# Altium project Vehicle_Interface_Tester.PrjPcb
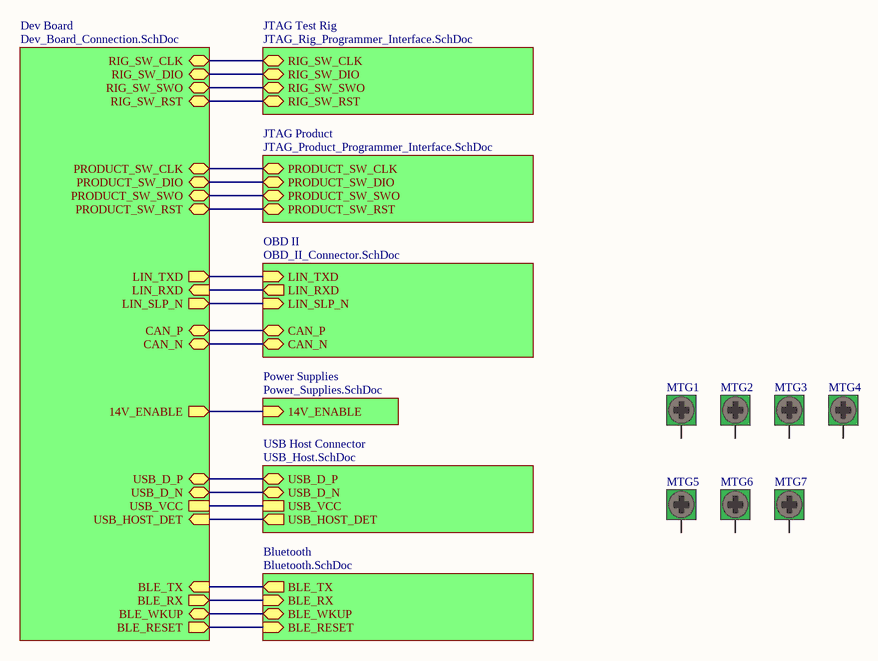
[diagram p0: Top_Level.SchDoc]
13 sheets, 100 parts. Net scope: hierarchical (ports join the sheet entries above them; power ports are global).
Board file: Vehicle_Interface_Tester.PcbDoc
Sheets:
  Top_Level.SchDoc
    Dev Board = Dev_Board_Connection.SchDoc
    Power Supplies = Power_Supplies.SchDoc
      Input Power = Input_Power.SchDoc
      14V Buck Supply = 14V_Buck.SchDoc
      Vehicle Power = Vehicle_Power.SchDoc
      3V3 Buck Supply = 3V3_Buck.SchDoc
    USB Host Connector = USB_Host.SchDoc
    Bluetooth = Bluetooth.SchDoc
    OBD II = OBD_II_Connector.SchDoc
      K-Line = K-Line.SchDoc
    JTAG Product = JTAG_Product_Programmer_Interface.SchDoc
    JTAG Test Rig = JTAG_Rig_Programmer_Interface.SchDoc

## Sheet Top_Level.SchDoc
size A; Author: Jared Ainsworth; CompanyName: UpRev LLC; Engineer: Jared Ainsworth; Organization: UpRev LLC; Address1: 4807 Commercial Park Dr.; Address2: Austin, TX 78724; Address3: United States; Address4: www.UpRev.com; SheetNumber: 1; SheetTotal: 13

### Parts
MTG1  Mounting Hole M3  [Mounting Hole M3]  (value not drawn)  (no BOM)
MTG2  Mounting Hole M3  [Mounting Hole M3]  (value not drawn)  (no BOM)
MTG3  Mounting Hole M3  [Mounting Hole M3]  (value not drawn)  (no BOM)
MTG4  Mounting Hole M3  [Mounting Hole M3]  (value not drawn)  (no BOM)
MTG5  Mounting Hole M3  [Mounting Hole M3]  (value not drawn)  (no BOM)
MTG6  Mounting Hole M3  [Mounting Hole M3]  (value not drawn)  (no BOM)
MTG7  Mounting Hole M3  [Mounting Hole M3]  (value not drawn)  (no BOM)

### Sub-sheets
Bluetooth = Bluetooth.SchDoc: BLE_TX (out), BLE_RX (in), BLE_WKUP (bidir), BLE_RESET (in)
Dev Board = Dev_Board_Connection.SchDoc: RIG_SW_CLK (bidir), RIG_SW_DIO (bidir), RIG_SW_SWO (bidir), RIG_SW_RST (bidir), PRODUCT_SW_CLK (bidir), PRODUCT_SW_DIO (bidir), PRODUCT_SW_SWO (bidir), PRODUCT_SW_RST (bidir), LIN_TXD (out), LIN_RXD (in), LIN_SLP_N (out), CAN_P (bidir), CAN_N (bidir), BLE_RESET (out), BLE_WKUP (bidir), BLE_RX (out), BLE_TX (in), USB_HOST_DET (in), USB_VCC, USB_D_N (bidir), USB_D_P (bidir), 14V_ENABLE (out)
JTAG Product = JTAG_Product_Programmer_Interface.SchDoc: PRODUCT_SW_CLK (bidir), PRODUCT_SW_DIO (bidir), PRODUCT_SW_RST (bidir), PRODUCT_SW_SWO (bidir)
JTAG Test Rig = JTAG_Rig_Programmer_Interface.SchDoc: RIG_SW_CLK (bidir), RIG_SW_DIO (bidir), RIG_SW_SWO (bidir), RIG_SW_RST (bidir)
OBD II = OBD_II_Connector.SchDoc: LIN_TXD (in), LIN_RXD (out), LIN_SLP_N (in), CAN_P (bidir), CAN_N (bidir)
Power Supplies = Power_Supplies.SchDoc: 14V_ENABLE (in)
USB Host Connector = USB_Host.SchDoc: USB_D_P (bidir), USB_D_N (bidir), USB_VCC, USB_HOST_DET (out)

### Nets
VBUS: sheet Dev Board/USB_VCC, sheet USB Host Connector/USB_VCC
BLE_RESET: sheet Dev Board/BLE_RESET, sheet Bluetooth/BLE_RESET
BLE_RX: sheet Dev Board/BLE_RX, sheet Bluetooth/BLE_RX
BLE_TX: sheet Dev Board/BLE_TX, sheet Bluetooth/BLE_TX
BLE_WKUP: sheet Dev Board/BLE_WKUP, sheet Bluetooth/BLE_WKUP
CAN_N: sheet Dev Board/CAN_N, sheet OBD II/CAN_N
CAN_P: sheet Dev Board/CAN_P, sheet OBD II/CAN_P
LIN_RXD: sheet Dev Board/LIN_RXD, sheet OBD II/LIN_RXD
LIN_SLP_N: sheet Dev Board/LIN_SLP_N, sheet OBD II/LIN_SLP_N
LIN_TXD: sheet Dev Board/LIN_TXD, sheet OBD II/LIN_TXD
USB_D_N: sheet Dev Board/USB_D_N, sheet USB Host Connector/USB_D_N
USB_D_P: sheet Dev Board/USB_D_P, sheet USB Host Connector/USB_D_P
NetJ1_10: sheet Dev Board/PRODUCT_SW_CLK, sheet JTAG Product/PRODUCT_SW_CLK
NetJ1_11: sheet Dev Board/14V_ENABLE, sheet Power Supplies/14V_ENABLE
NetJ1_13: sheet Dev Board/PRODUCT_SW_DIO, sheet JTAG Product/PRODUCT_SW_DIO
NetJ1_15: sheet Dev Board/PRODUCT_SW_RST, sheet JTAG Product/PRODUCT_SW_RST
NetJ1_16: sheet Dev Board/PRODUCT_SW_SWO, sheet JTAG Product/PRODUCT_SW_SWO
NetJ3_4: sheet Dev Board/USB_HOST_DET, sheet USB Host Connector/USB_HOST_DET
NetJ5_2: sheet Dev Board/RIG_SW_CLK, sheet JTAG Test Rig/RIG_SW_CLK
NetJ5_4: sheet Dev Board/RIG_SW_DIO, sheet JTAG Test Rig/RIG_SW_DIO
NetJ5_5: sheet Dev Board/RIG_SW_RST, sheet JTAG Test Rig/RIG_SW_RST
NetJ5_6: sheet Dev Board/RIG_SW_SWO, sheet JTAG Test Rig/RIG_SW_SWO

Not connected (* = marked no-connect by the designer): MTG1 1(M3_Mounting_Hole); MTG2 1(M3_Mounting_Hole); MTG3 1(M3_Mounting_Hole); MTG4 1(M3_Mounting_Hole); MTG5 1(M3_Mounting_Hole); MTG6 1(M3_Mounting_Hole); MTG7 1(M3_Mounting_Hole)

### Notes on the sheet
- Title
- Size:
- Engineer:
- A
- Number:
- Revision:
- Sheet
- of
- File:

### Library data of the parts
MTG1-MTG7 = Mounting Hole M3: M3 Mounting Hole; Manufacturer Part Number: DNP; Manufacturer: DNP

## Sheet Dev_Board_Connection.SchDoc
size A; Author: Jared Ainsworth; CompanyName: UpRev LLC; Engineer: Jared Ainsworth; Organization: UpRev LLC; Address1: 4807 Commercial Park Dr.; Address2: Austin, TX 78724; Address3: United States; Address4: www.UpRev.com; SheetNumber: 2; SheetTotal: 13
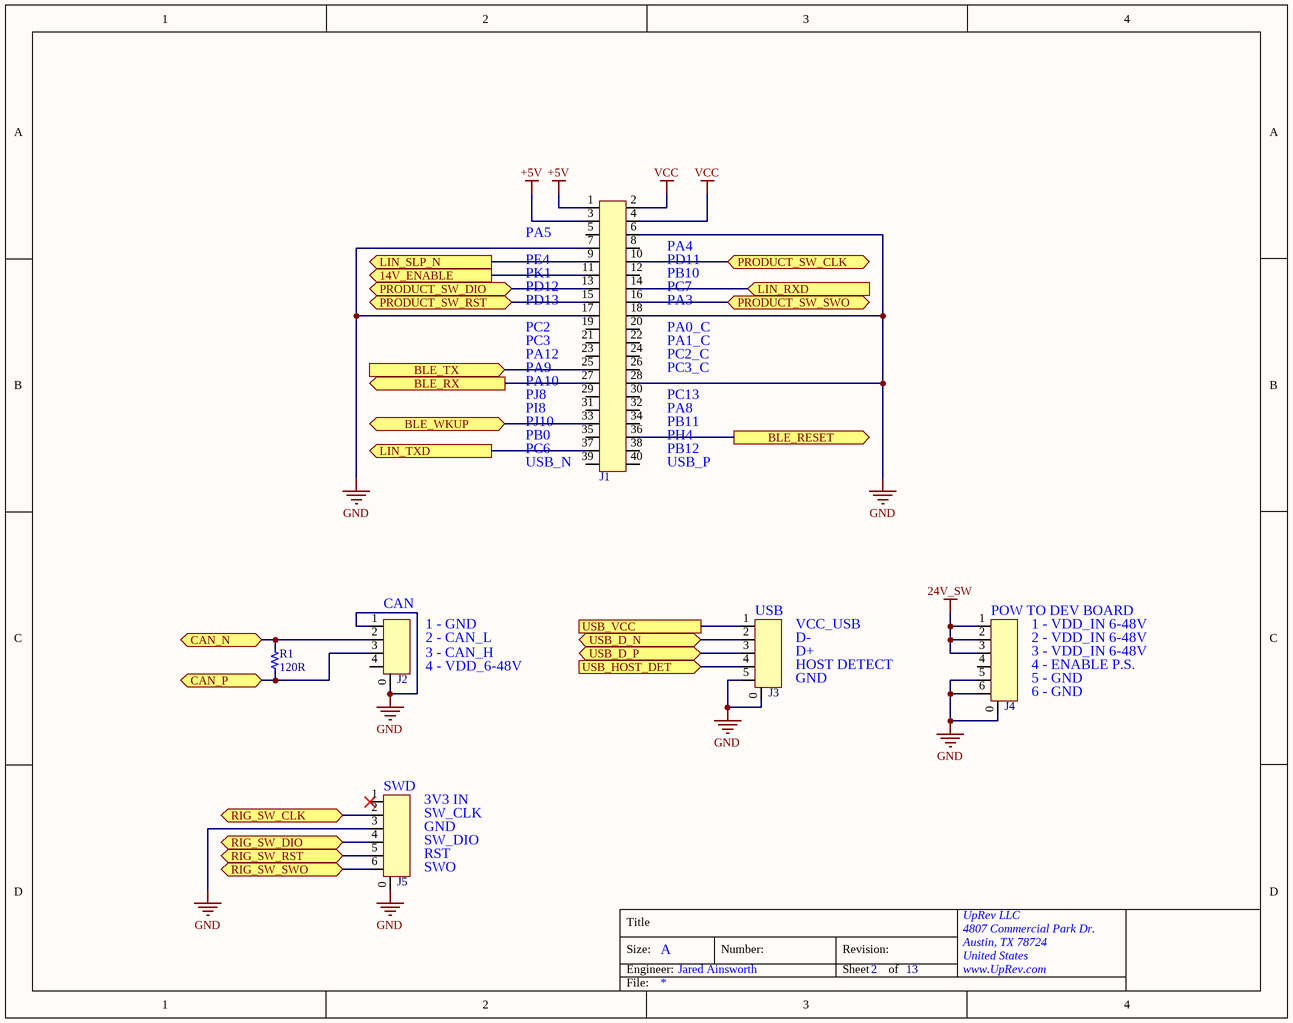
[diagram p1: Dev_Board_Connection.SchDoc]

### Parts
J1  HC-PM127-4.3H-2x20PS  [Connector 40 Pos Header 1.27mm (.5") HC-PM127-4.3H-2x20PS]  (value not drawn)
J2  532610471  [Connector 4 pos PicoBlade Molex 532610001]  (value not drawn)
J3  532610671  [Connector 5 pos PicoBlade Molex 532610571]  (value not drawn)
J4  532610571  [Connector 6 pos PicoBlade Molex 532610001]  (value not drawn)
J5  532610571  [Connector 6 pos PicoBlade Molex 532610001]  (value not drawn)
R1  120R  [R1206 (3216)]

### Ports
14V_ENABLE (out, see Top_Level[2C], Power_Supplies[2C], Vehicle_Power[1C]), BLE_RESET (out, see Top_Level[2D], Bluetooth[3B]), BLE_RX (out, see Top_Level[2D], Bluetooth[1B]), BLE_TX (in, see Top_Level[2D], Bluetooth[1C]), BLE_WKUP (bidir, see Top_Level[2D], Bluetooth[1B]), CAN_N (bidir, see Top_Level[2C], OBD_II_Connector[1B]), CAN_P (bidir, see Top_Level[2C], OBD_II_Connector[1B]), LIN_RXD (in, see Top_Level[2B], K-Line[1B], OBD_II_Connector[1B]), LIN_SLP_N (out, see Top_Level[2B], K-Line[1B], OBD_II_Connector[1B]), LIN_TXD (out, see Top_Level[2B], K-Line[1C], OBD_II_Connector[1B]), PRODUCT_SW_CLK (bidir, see Top_Level[2B], JTAG_Product_Programmer_Interface[3B]), PRODUCT_SW_DIO (bidir, see Top_Level[2B], JTAG_Product_Programmer_Interface[3B]), PRODUCT_SW_RST (bidir, see Top_Level[2B], JTAG_Product_Programmer_Interface[3C]), PRODUCT_SW_SWO (bidir, see Top_Level[2B], JTAG_Product_Programmer_Interface[3C]), RIG_SW_CLK (bidir, see Top_Level[2A], JTAG_Rig_Programmer_Interface[3B]), RIG_SW_DIO (bidir, see Top_Level[2B], JTAG_Rig_Programmer_Interface[3B]), RIG_SW_RST (bidir, see Top_Level[2B], JTAG_Rig_Programmer_Interface[3C]), RIG_SW_SWO (bidir, see Top_Level[2B], JTAG_Rig_Programmer_Interface[3C]), USB_D_N (bidir, see Top_Level[2C], USB_Host[1B]), USB_D_P (bidir, see Top_Level[2C], USB_Host[1B]), USB_HOST_DET (in, see Top_Level[2C], USB_Host[1B]), USB_VCC (see Top_Level[2C], USB_Host[1B])

### Nets
24V_SW: J4.1 J4.2 J4.3
+5V: J1.1 J1.3
GND: J1.6 J1.7 J1.17 J1.18 J1.28 J2.0 J2.1 J3.0 J3.5 J4.0 J4.5 J4.6 J5.0 J5.3
VBUS: J3.1 ; port USB_VCC
VCC: J1.2 J1.4
BLE_RESET: J1.36 ; port BLE_RESET
BLE_RX: J1.27 ; port BLE_RX
BLE_TX: J1.25 ; port BLE_TX
BLE_WKUP: J1.33 ; port BLE_WKUP
CAN_N: J2.2 R1.2 ; port CAN_N
CAN_P: J2.3 R1.1 ; port CAN_P
LIN_RXD: J1.14 ; port LIN_RXD
LIN_SLP_N: J1.9 ; port LIN_SLP_N
LIN_TXD: J1.37 ; port LIN_TXD
USB_D_N: J3.2 ; port USB_D_N
USB_D_P: J3.3 ; port USB_D_P
NetJ1_10: J1.10 ; port PRODUCT_SW_CLK
NetJ1_11: J1.11 ; port 14V_ENABLE
NetJ1_13: J1.13 ; port PRODUCT_SW_DIO
NetJ1_15: J1.15 ; port PRODUCT_SW_RST
NetJ1_16: J1.16 ; port PRODUCT_SW_SWO
NetJ3_4: J3.4 ; port USB_HOST_DET
NetJ5_2: J5.2 ; port RIG_SW_CLK
NetJ5_4: J5.4 ; port RIG_SW_DIO
NetJ5_5: J5.5 ; port RIG_SW_RST
NetJ5_6: J5.6 ; port RIG_SW_SWO

Not connected (* = marked no-connect by the designer): J1 5 8 12 19 20 21 22 23 24 26 29 30 31 32 34 35 38 39 40; J2 4; J4 4; J5 1*

### Notes on the sheet
- (near J1) PA5
- (near J1) PE4
- (near J1) PK1
- (near J1) PD12
- (near J1) PA4
- (near J1) PD11
- (near J1) PB10
- (near J1) PC7
- (near J1) PD13
- (near J1) PC2
- (near J1) PC3
- (near J1) PA12
- (near J1) PA9
- (near J1) PA3
- (near J1) PA0_C
- (near J1) PA1_C
- (near J1) PC2_C
- (near J1) PC3_C
- (near J1) PA10
- (near J1) PJ8
- (near J1) PI8
- (near J1) PJ10
- (near J1) PC13
- (near J1) PA8
- (near J1) PB11
- (near J1) PB0
- (near J1) PC6
- (near J1) USB_N
- (near J1) PH4
- (near J1) PB12
- (near J1) USB_P
- (near J2) CAN
- (near J2) 1 - GND
- (near J2) 2 - CAN_L
- (near J3) USB
- (near J3) VCC_USB
- (near J3) D-
- (near J4) POW TO DEV BOARD
- (near J4) 1 - VDD_IN 6-48V
- (near J4) 2 - VDD_IN 6-48V
- (near J2) 3 - CAN_H
- (near J2) 4 - VDD_6-48V
- (near J3) D+
- (near J3) HOST DETECT
- (near J3) GND
- (near J4) 3 - VDD_IN 6-48V
- (near J4) 4 - ENABLE P.S.
- (near J4) 5 - GND
- (near J4) 6 - GND
- (near J5) SWD
- (near J5) 3V3 IN
- (near J5) SW_CLK
- (near J5) GND
- (near J5) SW_DIO
- (near J5) RST
- (near J5) SWO
- Title
- Size:
- Engineer:
- A
- Number:
- Revision:
- Sheet
- of
- File:

### Library data of the parts
J1 = HC-PM127-4.3H-2x20PS: 40 Pos, 1.27mm Pitch, Socket, Vertical SMD; Manufacturer: Hong Cheng; Package: SMD,P=1.27mm; Manufacturer Part Number: HC-PM127-4.3H-2x20PS; LCSC Part Number: C22436137
J2 = 532610471: 4 Pos, 1.25mm Pitch, PicoBlade, Horizontal SMD; Manufacturer: MOLEX; Package: SMD,P=1.25mm,Surface Mount，Right Angle; Manufacturer Part Number: 532610471; LCSC Part Number: C696092
J3 = 532610671: 5 Pos, 1.25mm Pitch, PicoBlade, Horizontal SMD; Manufacturer: MOLEX; Manufacturer Part Number: 532610571; Package: SMD,P=1.25mm,Surface Mount，Right Angle; LCSC Part Number: C17256390
J4 J5 = 532610571: 6 Pos, 1.25mm Pitch, PicoBlade, Horizontal SMD; Manufacturer: MOLEX; Manufacturer Part Number: 532610671; Package: SMD,P=1.25mm,Surface Mount，Right Angle; LCSC Part Number: C17393620
R1 = 120 ohm, 1206 (3216): 120 ohm, Resistor, ±1%, 1/4W, 1206 (3216); Manufacturer: UNI-ROYAL(Uniroyal Elec); Manufacturer Part Number: 1206W4F1200T5E; Package: 1206 (3216 metric); LCSC Part Number: C17909; Value: 120R

## Sheet Power_Supplies.SchDoc
size A; Author: Jared Ainsworth; CompanyName: UpRev LLC; Engineer: Jared Ainsworth; Organization: UpRev LLC; Address1: 4807 Commercial Park Dr.; Address2: Austin, TX 78724; Address3: United States; Address4: www.UpRev.com; SheetNumber: 9; SheetTotal: 13
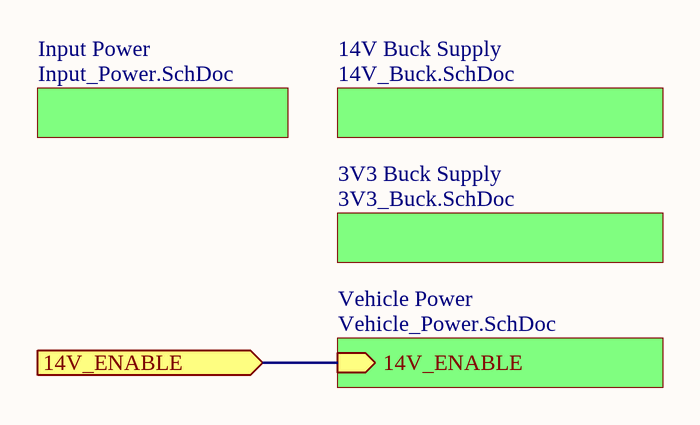
[diagram p2: Power_Supplies.SchDoc]

### Sub-sheets
3V3 Buck Supply = 3V3_Buck.SchDoc: no entries
14V Buck Supply = 14V_Buck.SchDoc: no entries
Input Power = Input_Power.SchDoc: no entries
Vehicle Power = Vehicle_Power.SchDoc: 14V_ENABLE (in)

### Ports
14V_ENABLE (in, see Top_Level[2C], Dev_Board_Connection[2B], Vehicle_Power[1C])

### Nets
NetJ1_11: port 14V_ENABLE, sheet Vehicle Power/14V_ENABLE

### Notes on the sheet
- Title
- Size:
- Engineer:
- A
- Number:
- Revision:
- Sheet
- of
- File:

## Sheet Input_Power.SchDoc
size A; Author: Jared Ainsworth; CompanyName: UpRev LLC; Engineer: Jared Ainsworth; Organization: UpRev LLC; Address1: 4807 Commercial Park Dr.; Address2: Austin, TX 78724; Address3: United States; Address4: www.UpRev.com; SheetNumber: 10; SheetTotal: 13
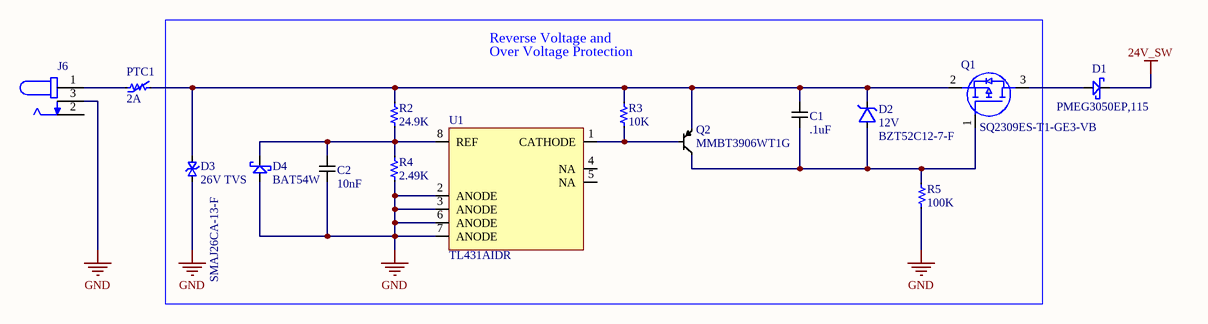
[diagram p3: Input_Power.SchDoc]

### Parts
C1  .1uF  [C0603 (1608)]
C2  10nF  [C0805 (2012)]
D1  PMEG3050EP,115  [SOD-128]
D2  Zener Voltage: 12V  [SOD-123 Diode]  (hidden comment: BZT52C12-7-F)
D3  26V TVS  [Diodes_SMA_0]
D4  BAT54W  [Diode SOD-123]
J6  PJ-002A  [Connector PJ-002A]  (value not drawn)
PTC1  2A  [R1210 (3225)]
Q1  SQ2309ES-T1-GE3-VB  [SOT-23-3]
Q2  Manufacturer Part Number: MMBT3906WT1G  [SC70 (SOT-323)]  (hidden comment: MMBT3906)
R2  24.9K  [R0603 (1608)]
R3  10K  [R0402 (1005)]
R4  2.49K  [R0603 (1608)]
R5  100K  [R0603 (1608)]
U1  TL431AIDR  [SOIC-8]

### Nets
24V_SW: D1.1(Cathode)
GND: C2.2 D3.1 D4.2(Anode) J6.3 R4.1 R5.2 U1.2(ANODE) U1.3(ANODE) U1.6(ANODE) U1.7(ANODE)
NetC1_1: C1.1 D2.1(Cathode) D3.2 PTC1.2 Q1.2(S) Q2.2(E) R2.2 R3.2
NetC1_2: C1.2 D2.2(Anode) Q1.1(G) Q2.3(C) R5.1
NetC2_1: C2.1 D4.1(Cathode) R2.1 R4.2 U1.8(REF)
NetD1_2: D1.2(Anode) Q1.3(D)
NetJ6_1: J6.1 PTC1.1
NetQ2_1: Q2.1(B) R3.1 U1.1(CATHODE)

Not connected (* = marked no-connect by the designer): J6 2; U1 4(NA) 5(NA)

### Notes on the sheet
- (near R3) Over Voltage Protection
- Reverse Voltage and
- Title
- Size:
- Engineer:
- A
- Number:
- Revision:
- Sheet
- of
- File:

### Library data of the parts
C1 = 100nF Ceramic, 25V, 0603 (1608): 100nF Ceramic Capacitor, 25V, X7R, ±10%, 0603 (1608); Manufacturer Part Number: CL10B104KA8NNNC; Manufacturer: Samsung Electro-Mechanics; Package: 0603 (1608 metric); LCSC Part Number: C1590; Value: .1uF
C2 = 10nF Ceramic, 50V, 0805 (2012): 10nF Ceramic Capacitor, 50V, ±10%, 0805 (2012); Manufacturer Part Number: CL21B103KBANNNC; Manufacturer: Samsung Electro-Mechanics; Package: 0805 (2012 metric); Value: 10nF; LCSC Part Number: C1710; Footprint: 0805
D1 = PMEG3050EP,115: Schottky Diode, 5A, 30V, SOD-128; Manufacturer: Nexperia; Package: SOD-128; LCSC Part Number: C50603; Manufacturer Part Number: PMEG3050EP,115
D2 = BZT52C12-7-F: Zener Diode, 12V, 500mW, Surface Mount SOD-123; Manufacturer: Diodes Incorporated; LCSC Part Number: C124196; Package: SOD-123; Manufacturer Part Number: BZT52C12-7-F
D3 = SMAJ26CA-13-F: 26V TVS Diode 9.5A Bidirectional Surface Mount DO-214AC; Manufacturer: Diodes Incorporated; Package: SMA; LCSC Part Number: C134976; Value: 26V TVS; Manufacturer Part Number: SMAJ26CA-13-F
D4 = BAT54W: Schottky Diode, 600mA, 30V, SOD-123; Manufacturer: Yangzhou Yangjie Elec Tech; Package: SOD-123; LCSC Part Number: C699107; Footprint: SOD-123; Manufacturer Part Number: BAT54W
J6 = PJ-002A: Barrel Connector Socket 5.5x2mm; Manufacturer: CUI; Mating Connector: 1757022; Part Number: PJ-002A; Manufacturer Part Number: PJ-002A; LCSC Part Number: C3096082; Package: Plugin,P=5.08mm
PTC1 = SMD1210P200TF: 2A Resettable Fuse, 1210; Manufacturer: RUILON(Shenzhen Ruilongyuan Elec); Package: 1210; Manufacturer Part Number: SMD1210P200TF; LCSC Part Number: C20808; Value: 2A
Q1 = SQ2309ES-T1-GE3-VB: MOSFET P-Channel, 60V, VBsemi Elec SQ2309ES-T1-GE3-VB; Manufacturer: VBsemi Elec; Manufacturer Part Number: SQ2309ES-T1-GE3-VB; LCSC Part Number: C6705325; Package: SOT-23(TO-236)
Q2 = PNP BiPolar Transistor (BJT), 40V, MMBT3906WT1G: PNP Bipolar Transistor (BJT), 200mA, 40V, SOT-323-3, ON Semi MMBT3906WT1G; Manufacturer: ON Semiconductor; LCSC Part Number: C150043; Package: SOT-323-3
R2 = 24.9K ohm, 0603 (1608): 24.9K ohm, Resistor, ±1%, 0603 (1608); Manufacturer: UNI-ROYAL(Uniroyal Elec); Manufacturer Part Number: 0603WAF2492T5E; Package: 0603 (1608 metric); LCSC Part Number: C25962; Value: 24.9K
R3 = 10K ohm, 0402 (1005): 10K ohm, Resistor, ±1%, 0402 (1005); Manufacturer: Ever Ohms Tech; Manufacturer Part Number: CR0402F10K0Q10Z; Power: 100mW; Package: 0402 (1005 metric); LCSC Part Number: C881209; Value: 10K
R4 = 2.49K ohm, 0603 (1608): 2.49K ohm, Resistor, ±1%, 0603 (1608); Manufacturer: UNI-ROYAL(Uniroyal Elec); Manufacturer Part Number: 0603WAF2491T5E; Package: 0603 (1608 metric); LCSC Part Number: C22908; Value: 2.49K
R5 = 100K ohm, 0603 (1608): 100K ohm, Resistor, ±1%, 0603 (1608); Manufacturer: YAGEO; Manufacturer Part Number: RC0603FR-07100KL; Package: 0603 (1608 metric); LCSC Part Number: C14675; Value: 100K
U1 = TL431AIDR: Shunt Voltage Reference IC Adjustable 2.495V 36 VV ±1; Manufacturer: Texas Instruments; LCSC Part Number: C6970; Package: SOIC-8; Manufacturer Part Number: TL431AIDR

## Sheet 14V_Buck.SchDoc
size A; Author: Jared Ainsworth; CompanyName: UpRev LLC; Engineer: Jared Ainsworth; Organization: UpRev LLC; Address1: 4807 Commercial Park Dr.; Address2: Austin, TX 78724; Address3: United States; Address4: www.UpRev.com; SheetNumber: 12; SheetTotal: 13
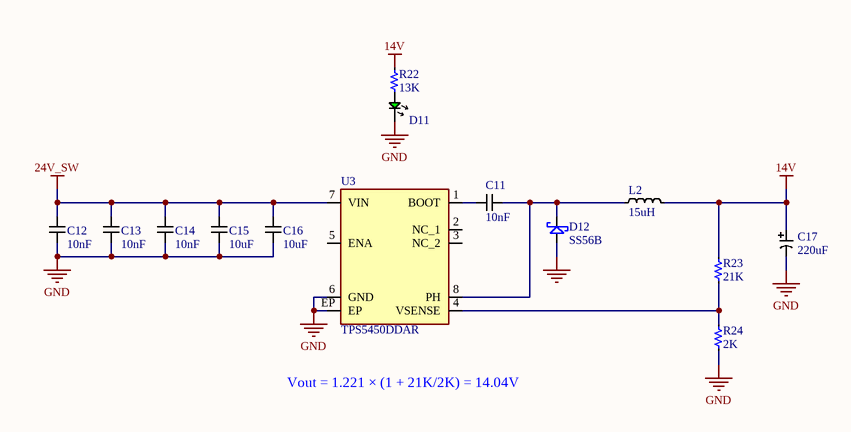
[diagram p4: 14V_Buck.SchDoc]

### Parts
C11  10nF  [C0402 (1005)]
C12  10nF  [C0402 (1005)]
C13  10nF  [C0402 (1005)]
C14  10nF  [C0402 (1005)]
C15  10uF  [C1206 (3216)]
C16  10uF  [C1206 (3216)]
C17  220uF  [Cap D10xL10.2mm]
D11  Green  [LED Green 0402 (1005)]  (value not drawn)
D12  SS56B  [DO-214AA]
L2  15uH  [Inductor 11.5x10mm SMD]
R22  13K  [R0402 (1005)]
R23  21K  [R0402 (1005)]
R24  2K  [R0402 (1005)]
U3  TPS5450DDAR  [SOP-8-EP-150mil]

### Nets
14V: C17.1(+) L2.2 R22.2 R23.2
24V_SW: C12.1 C13.1 C14.1 C15.1 C16.1 U3.7(VIN)
GND: C12.2 C13.2 C14.2 C15.2 C16.2 C17.2 D11.1(Gnd) D12.2(Anode) R24.1 U3.6(GND) U3.EP
NetC11_1: C11.1 U3.1(BOOT)
NetC11_2: C11.2 D12.1(Cathode) L2.1 U3.8(PH)
NetD11_2: D11.2(+) R22.1
NetR23_1: R23.1 R24.2 U3.4(VSENSE)

Not connected (* = marked no-connect by the designer): U3 2(NC_1) 3(NC_2) 5(ENA)

### Notes on the sheet
- Vout = 1.221 × (1 + 21K/2K) = 14.04V
- Title
- Size:
- Engineer:
- A
- Number:
- Revision:
- Sheet
- of
- File:

### Library data of the parts
C11-C14 = 10nF Ceramic, 50V, 0402 (1005): 10nF Ceramic Capacitor, 50V, ±10%, 0402 (1005); Manufacturer Part Number: CL05B103KB5NNNC; Manufacturer: Samsung Electro-Mechanics; Package: 0402 (1005 metric); Value: 10nF; LCSC Part Number: C15195; Footprint: 0402
C15 C16 = 10uF Ceramic, 50V, 1206 (3216): 10uF Ceramic Capacitor, 50V, ±10%, 1206 (3216); Manufacturer Part Number: CL31A106KBHNNNE; Manufacturer: Samsung Electro-Mechanics; Package: 1206 (3216 metric); Value: 10uF; LCSC Part Number: C13585
C17 = 220uF Aluminum Electrolytic, 50V, D10x10.2mm: 220uF Aluminum Electrolytic Capacitor, 50V, ±20%, D10x10.2mm; Manufacturer: DMBJ; Manufacturer Part Number: RVT1H221M1010 220UF 50V; Package: SMD,D6.3xL7.7mm; Value: 220uF; LCSC Part Number: C970698
D11 = LED Green, 0402 (1005): Manufacturer Part Number: NCD0402G1; Manufacturer: Foshan NationStar Optoelectronics; Forward Current: 20mA; Color: Green; Package: 0402; LCSC Part Number: C130723
D12 = Schottky, 5A, SS56B: Schottky Diode, 60V, 5A, DO-214AA, MDD SS56B; Manufacture: MDD(Microdiode Semiconductor); Package: SMB(DO-214AA); LCSC Part Number: C14651; Manufacturer Part Number: SS56B
L2 = 15uH 7A, 11.5x10mm: 15uH Inductor, 7A, ±20%, 11.5x10mm; Manufacturer Part Number: SMMS1040-150M; Manufacturer: SXN(Shun Xiang Nuo Elec); Package: SMD,11.5x10mm; LCSC Part Number: C149596; Value: 15uH
R22 = 13K ohm, 0402 (1005): 13K ohm, Resistor, ±1%, 0402 (1005); Manufacturer: UNI-ROYAL(Uniroyal Elec); Manufacturer Part Number: 0402WGF1302TCE; Package: 0402 (1005 metric); LCSC Part Number: C25754; Value: 13K
R23 = 21K ohm, 0402 (1005): 21K ohm, Resistor, ±1%, 0402 (1005); Manufacturer: UNI-ROYAL(Uniroyal Elec); Manufacturer Part Number: 0402WGF2102TCE; Package: 0402 (1005 metric); LCSC Part Number: C25766; Value: 21K
R24 = 2K ohm, 0402 (1005): 2K ohm, Resistor, ±1%, 0402 (1005); Manufacturer: UNI-ROYAL(Uniroyal Elec); Manufacturer Part Number: 0402WGF2001TCE; Package: 0402 (1005 metric); LCSC Part Number: C4109; Value: 2K
U3 = TPS5450DDAR: Texas Instruments switching V reg, step down, 5A wide range input TPS5450DDAR; Manufacturer Part Number: TPS5450DDAR; Manufacturer: Texas Instruments; LCSC Part Number: C114425; Package: SOP-8-EP-150mil

## Sheet Vehicle_Power.SchDoc
size A; Author: Jared Ainsworth; CompanyName: UpRev LLC; Engineer: Jared Ainsworth; Organization: UpRev LLC; Address1: 4807 Commercial Park Dr.; Address2: Austin, TX 78724; Address3: United States; Address4: www.UpRev.com; SheetNumber: 11; SheetTotal: 13
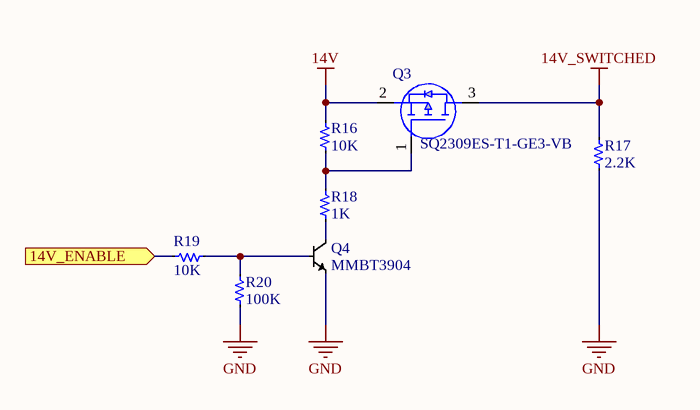
[diagram p5: Vehicle_Power.SchDoc]

### Parts
Q3  SQ2309ES-T1-GE3-VB  [SOT-23-3]
Q4  MMBT3904  [SOT-23-3]
R16  10K  [R0402 (1005)]
R17  2.2K  [R1206 (3216)]
R18  1K  [R0402 (1005)]
R19  10K  [R0402 (1005)]
R20  100K  [R0402 (1005)]

### Ports
14V_ENABLE (in, see Power_Supplies[2C], Dev_Board_Connection[2B], Power_Supplies[2C])

### Nets
14V: Q3.2(S) R16.2
14V_SWITCHED: Q3.3(D) R17.2
GND: Q4.2(C) R17.1 R20.1
NetJ1_11: R19.2 ; port 14V_ENABLE
NetQ3_1: Q3.1(G) R16.1 R18.2
NetQ4_1: Q4.1(B) R19.1 R20.2
NetQ4_3: Q4.3(E) R18.1

### Notes on the sheet
- Title
- Size:
- Engineer:
- A
- Number:
- Revision:
- Sheet
- of
- File:

### Library data of the parts
Q3 = SQ2309ES-T1-GE3-VB: as Q1 on sheet Input_Power; Manufacturer: VBsemi Elec; Manufacturer Part Number: SQ2309ES-T1-GE3-VB; LCSC Part Number: C6705325; Package: SOT-23(TO-236)
Q4 = MMBT3904(RANGE:100-300): NPN Bipolar Transistor (BJT), 40V, 200mA, SOT-23-3; Manufacturer: Jiangsu Changjing Electronics Technology Co., Ltd.; Package: SOT-23; LCSC Part Number: C20526; Manufacturer Part Number: MMBT3904(RANGE:100-300)
R16 R19 = 10K ohm, 0402 (1005): as R3 on sheet Input_Power; Package: 0402 (1005 metric); LCSC Part Number: C881209; Value: 10K
R17 = 2.2K ohm, 1206 (3216): 2.2K ohm, Resistor, ±1%, 1/4W, 1206 (3216); Manufacturer: UNI-ROYAL(Uniroyal Elec); Manufacturer Part Number: 1206W4F2201T5E; Package: 1206 (3216 metric); LCSC Part Number: C17948; Value: 2.2K
R18 = 1K ohm, 0402 (1005): 1K ohm, Resistor, ±1%, 0402 (1005); Manufacturer: UNI-ROYAL(Uniroyal Elec); Manufacturer Part Number: 0402WGF1001TCE; Package: 0402 (1005 metric); Cost: 0.013; LCSC Part Number: C11702; Value: 1K
R20 = 100K ohm, 0402 (1005): 100K ohm, Resistor, ±1%, 0402 (1005); Manufacturer: UNI-ROYAL(Uniroyal Elec); Manufacturer Part Number: 0402WGF1003TCE; Package: 0402 (1005 metric); Part Number: 0402WGF1003TCE; LCSC Part Number: C25741; Value: 100K

## Sheet 3V3_Buck.SchDoc
size A; Author: Jared Ainsworth; CompanyName: UpRev LLC; Engineer: Jared Ainsworth; Organization: UpRev LLC; Address1: 4807 Commercial Park Dr.; Address2: Austin, TX 78724; Address3: United States; Address4: www.UpRev.com; SheetNumber: 13; SheetTotal: 13
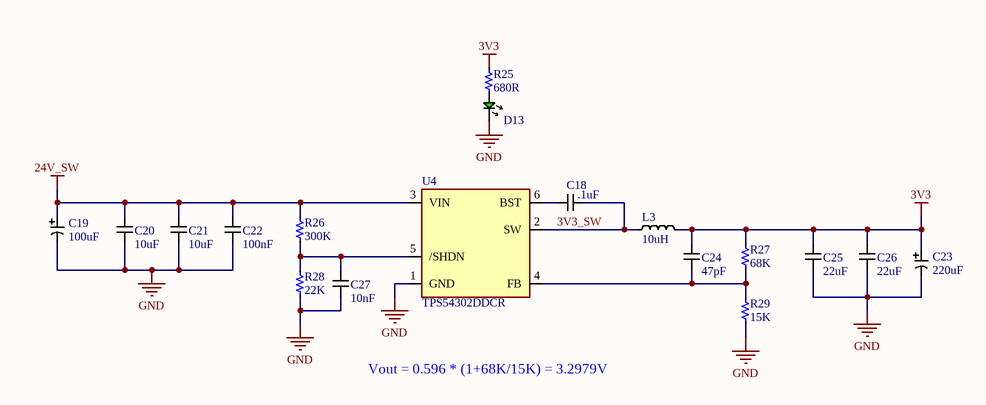
[diagram p6: 3V3_Buck.SchDoc]

### Parts
C18  .1uF  [C0805 (2012)]
C19  100uF  [Cap D8xL10.2mm]
C20  10uF  [C1206 (3216)]
C21  10uF  [C1206 (3216)]
C22  100nF  [C0603 (1608)]
C23  220uF  [Cap D6.3xL7.7mm]
C24  47pF  [C0402 (1005)]
C25  22uF  [C1206 (3216)]
C26  22uF  [C1206 (3216)]
C27  10nF  [C0402 (1005)]
D13  Green  [LED Green 0402 (1005)]  (value not drawn)
L3  10uH  [Inductor 7.2x6.6mm SMD]
R25  680R  [R0402 (1005)]
R26  300K  [R0402 (1005)]
R27  68K  [R0402 (1005)]
R28  22K  [R0402 (1005)]
R29  15K  [R0402 (1005)]
U4  TPS54302DDCR  [SOT-23-6]

### Nets
3V3: C23.1(+) C24.1 C25.1 C26.1 L3.2 R25.2 R27.2
24V_SW: C19.1(+) C20.1 C21.1 C22.1 R26.2 U4.3(VIN)
GND: C19.2 C20.2 C21.2 C22.2 C23.2 C25.2 C26.2 C27.2 D13.1(Gnd) R28.1 R29.1 U4.1(GND)
3V3_SW: C18.2 L3.1 U4.2(SW)
NetC18_1: C18.1 U4.6(BST)
NetC24_2: C24.2 R27.1 R29.2 U4.4(FB)
NetC27_1: C27.1 R26.1 R28.2 U4.5(/SHDN)
NetD13_2: D13.2(+) R25.1

### Notes on the sheet
- Vout = 0.596 * (1+68K/15K) = 3.2979V
- Title
- Size:
- Engineer:
- A
- Number:
- Revision:
- Sheet
- of
- File:

### Library data of the parts
C18 = 100nF Ceramic, 50V, 0805 (2012): 100nF Ceramic Capacitor, 50V, X7R, ±10%, 0805 (2012); Manufacturer Part Number: CL21B104KBCNNNC; Manufacturer: Samsung Electro-Mechanics; Package: 0805 (2012 metric); Value: .1uF; LCSC Part Number: C1711; Footprint: 0805
C19 = 100uF Aluminum Electrolytic, 50V, D8xL10.2mm: 100uF Aluminum Electrolytic Capacitor, 50V, ±20%, D8xL10.2mm; Manufacturer: ROQANG; Manufacturer Part Number: RVT1H101M0810; Package: SMD,D8xL10.2mm; Value: 100uF; LCSC Part Number: C72480
C20 C21 = 10uF Ceramic, 50V, 1206 (3216): as C15 on sheet 14V_Buck; Package: 1206 (3216 metric); Value: 10uF; LCSC Part Number: C13585
C22 = 100nF Ceramic, 50V, 0603 (1608): 100nF Ceramic Capacitor, 50V, X7R, ±10%, 0603 (1608); Manufacturer Part Number: CC0603KRX7R9BB104; Manufacturer: YAGEO; Package: 0603 (1608 metric); Value: 100nF; LCSC Part Number: C14663
C23 = 220uF Aluminum Electrolytic, 25V, D6.3xL7.7mm_1: 220uF Aluminum Electrolytic Capacitor, 25V, ±20%, D6.3xL7.7mm; Manufacturer: ROQANG; Manufacturer Part Number: RVT1E221M0607; Package: SMD,D6.3xL7.7mm; Value: 220uF; LCSC Part Number: C2918361
C24 = 47pF Ceramic, 10V, 0402 (1005): 47pF Ceramic Capacitor, 50Vm C0G, ±5%, 0402 (1005); Manufacturer Part Number: TCC0402C0G470J500AT; Manufacturer: CCTC; Package: 0402 (1005 metric); LCSC Part Number: C466230; Value: 47pF
C25 C26 = 22uF Ceramic, 25V, 1206 (3216): 22uF Ceramic Capacitor, 25V, ±10%, 1206 (3216); Manufacturer Part Number: CL31A226KAHNNNE; Manufacturer: Samsung Electro-Mechanics; Package: 1206 (3216 metric); Value: 22uF; LCSC Part Number: C12891
C27 = 10nF Ceramic, 50V, 0402 (1005): as C11 on sheet 14V_Buck; Package: 0402 (1005 metric); Value: 10nF; LCSC Part Number: C15195; Footprint: 0402
D13 = LED Green, 0402 (1005): as D11 on sheet 14V_Buck; Color: Green; Package: 0402; LCSC Part Number: C130723
L3 = 10uH 6A, 7.2x6.6mm: 10uH Inductor, 5.5A, ±20%, 71mΩ, Shielded, 7.2x6mm; Manufacturer Part Number: CYA0630-10UH; Manufacturer: SHOU HAN; Package: SMD,7.2x6.6mm; LCSC Part Number: C5189958; Value: 10uH
R25 = 680 ohm, 0402 (1005): 680 ohm, Resistor, ±1%, 0402 (1005); Manufacturer: UNI-ROYAL(Uniroyal Elec); Manufacturer Part Number: 0402WGF6800TCE; Package: 0402 (1005 metric); LCSC Part Number: C25130; Value: 680R
R26 = 300K ohm, 0402 (1005): 300K ohm, Resistor, ±1%, 0402 (1005); Manufacturer: UNI-ROYAL(Uniroyal Elec); Manufacturer Part Number: 0402WGF3003TCE; Package: 0402 (1005 metric); LCSC Part Number: C25774; Value: 300K
R27 = 68K ohm, 0402 (1005): 68K ohm, Resistor, ±1%, 0402 (1005); Manufacturer: UNI-ROYAL(Uniroyal Elec); Manufacturer Part Number: 0402WGF6802TCE; Package: 0402 (1005 metric); LCSC Part Number: C36871; Value: 68K
R28 = 22K ohm, 0402 (1005): 22K ohm, Resistor, ±1%, 0402 (1005); Manufacturer: UNI-ROYAL(Uniroyal Elec); Manufacturer Part Number: 0402WGF2202TCE; Package: 0402 (1005 metric); LCSC Part Number: C25768; Value: 22K
R29 = 15K ohm, 0402 (1005): 15K ohm, Resistor, ±1%, 0402 (1005); Manufacturer: UNI-ROYAL(Uniroyal Elec); Manufacturer Part Number: 0402WGF1502TCE; Package: 0402 (1005 metric); LCSC Part Number: C25756; Value: 15K
U4 = TPS54302DDCR: Ti Switching V Regulator, Step Down, 3A, Ti TPS54302DDCR; Manufacturer Name: Texas Instruments; Manufacturer Part Number: TPS54302DDCR; Manufacturer: Texas Instruments; LCSC Part Number: C311983; Package: TSOT-23-6

## Sheet USB_Host.SchDoc
size A; Author: Jared Ainsworth; CompanyName: UpRev LLC; Engineer: Jared Ainsworth; Organization: UpRev LLC; Address1: 4807 Commercial Park Dr.; Address2: Austin, TX 78724; Address3: United States; Address4: www.UpRev.com; SheetNumber: 3; SheetTotal: 13
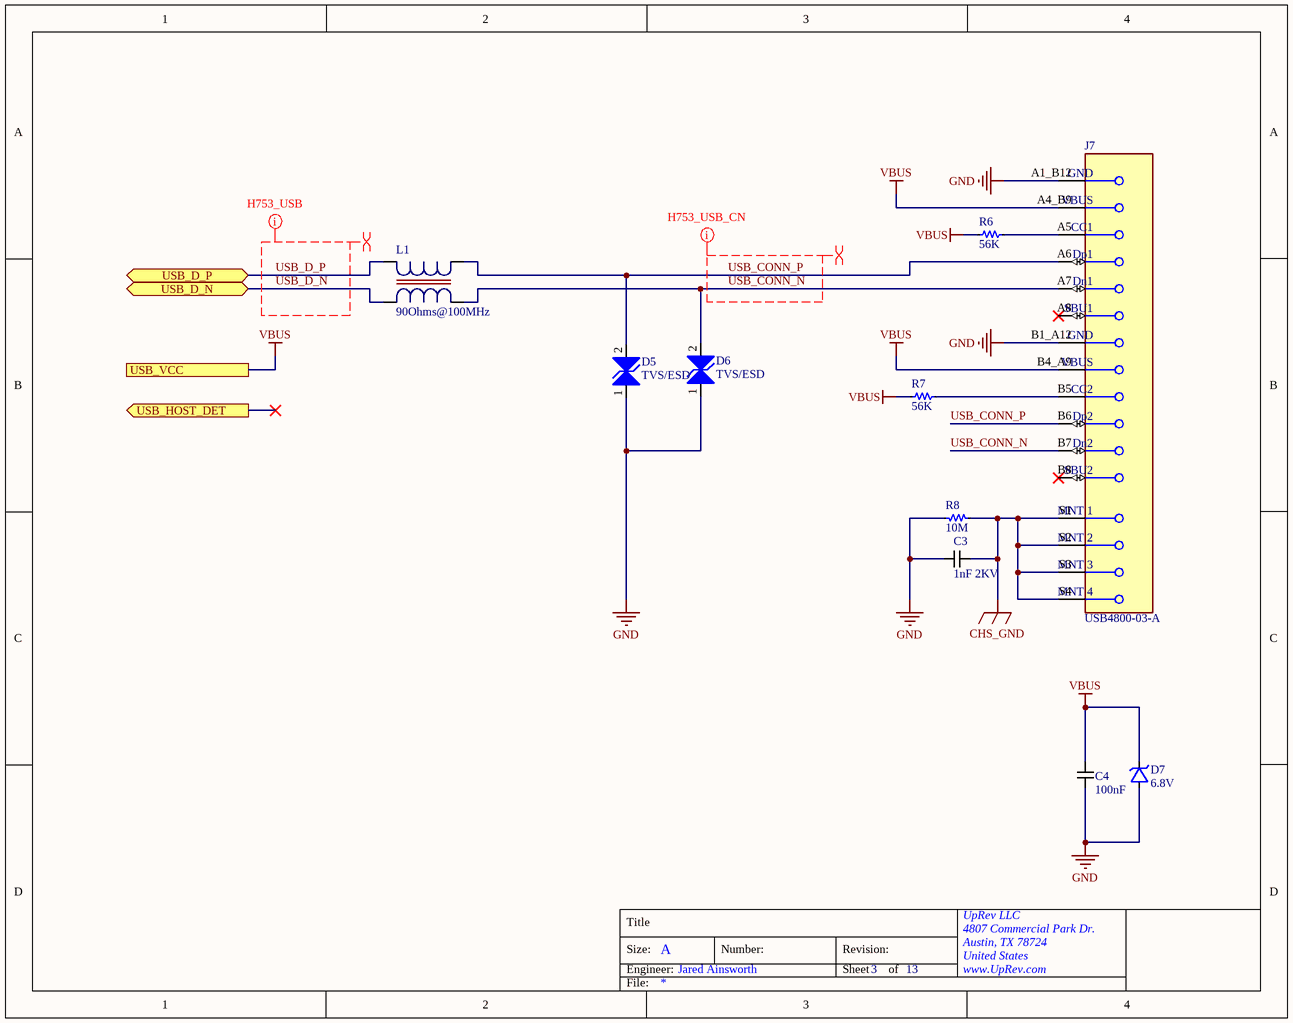
[diagram p7: USB_Host.SchDoc]

### Parts
C3  1nF 2KV  [C1206 (3216)]
C4  100nF  [C0402 (1005)]
D5  TVS/ESD  [R0402 (1005)]
D6  TVS/ESD  [R0402 (1005)]
D7  6.8V  [DO-214AC]
J7  USB4800-03-A  [Connector USB C Raised USB4800-03-A]
L1  value 90Ohms@100MHz  [INDUCTOR MCZ1210AH TDK]  (hidden comment: CMC 100MA 2LN 90 OHM SMD)
R6  56K  [R0402 (1005)]
R7  56K  [R0402 (1005)]
R8  10M  [R0805 (2012)]

### Ports
USB_D_N (bidir, see Top_Level[2C], Dev_Board_Connection[2C]), USB_D_P (bidir, see Top_Level[2C], Dev_Board_Connection[2C]), USB_HOST_DET (out, see Top_Level[2C], Dev_Board_Connection[2C]), USB_VCC (see Top_Level[2C], Dev_Board_Connection[2C])

### Nets
CHS_GND: C3.1 J7.S1(MNT_1) J7.S2(MNT_2) J7.S3(MNT_3) J7.S4(MNT_4) R8.1
GND: C3.2 C4.2 D5.1 D6.1 D7.2(Anode) J7.A1_B12(GND) J7.B1_A12(GND) R8.2
VBUS: C4.1 D7.1(Cathode) J7.A4_B9(VBUS) J7.B4_A9(VBUS) R6.1 R7.1 ; port USB_VCC
USB_CONN_N: D6.2 J7.A7(Dn1) J7.B7(Dn2) L1.2
USB_CONN_P: D5.2 J7.A6(Dp1) J7.B6(Dp2) L1.1
USB_D_N: L1.3 ; port USB_D_N
USB_D_P: L1.4 ; port USB_D_P
NetJ7_A5: J7.A5(CC1) R6.2
NetJ7_B5: J7.B5(CC2) R7.2

Not connected (* = marked no-connect by the designer): J7 A8(SBU1)* B8(SBU2)*

### Layout directives
differential pair; differential pair class ZDIFF90: USB_CONN_N, USB_CONN_P, USB_D_N, USB_D_P
net class H753_USB_CN: USB_CONN_N, USB_CONN_P
net class H753_USB: USB_D_N, USB_D_P

### Notes on the sheet
- Title
- Size:
- Engineer:
- A
- Number:
- Revision:
- Sheet
- of
- File:

### Library data of the parts
C3 = 1nF Ceramic, 2KV, X7R, 1206 (3216): 1nF Ceramic Capacitor, 2KV, X7R, ±10%, 1206 (3216); Manufacturer Part Number: CC1206KKX7RDBB102; Manufacturer: YAGEO; Package: 1206 (3216 metric); Value: 1nF 2KV; LCSC Part Number: C23631
C4 = 100nF Ceramic, 16V, 0402 (1005): 100nF Ceramic Capacitor, 16V, X7R, ±10%, 0402 (1005); Manufacturer Part Number: CL05B104KO5NNNC; Manufacturer: Samsung Electro-Mechanics; Package: 0402 (1005 metric); LCSC Part Number: C1525; Value: 100nF
D5 D6 = SESD0402X1BN-0010-098: 7V TVS Bidirectional, ESD Suppressors; Manufacturer: Littelfuse; Geometry.Height: 0.43mm; Manufacturer Part Number: SESD0402X1BN-0010-098; Value: TVS/ESD; LCSC Part Number: C2763588; Package: 0402
D7 = 1SMA4736A: 6.8V Zener Diode; Manufacturer: MDD(Microdiode Semiconductor); Package: SMA(DO-214AC); Manufacturer Part Number: 1SMA4736A; LCSC Part Number: C2858511
J7 = USB4800-03-A: CONN USB 2.0 TYPE-C R/A SMT RAISED; Manufacturer: Global Connector Technology; Package: SMD; Manufacturer Part Number: USB4800-03-A; LCSC Part Number: C5352763
L1 = MCZ1210AH900L2T: 2 Line Common Mode Choke Surface Mount 90 Ohms @ 100 MHz 100mA DCR 1.75Ohm; Manufacturer Part Number: MCZ1210AH900L2TA0G; Manufacturer: TDK; LCSC Part Number: C114784; Package: SMD-4P,1.2x1mm
R6 R7 = 56K ohm, 0402 (1005): 56K ohm, Resistor, ±1%, 0402 (1005); Manufacturer: UNI-ROYAL(Uniroyal Elec); Manufacturer Part Number: 0402WGF5602TCE; Package: 0402 (1005 metric); LCSC Part Number: C25796; Value: 56K
R8 = 10M ohm, 0805 (2012): 10M ohm, Resistor, ±1%, 0805 (2012); Manufacturer: UNI-ROYAL(Uniroyal Elec); Manufacturer Part Number: 0805W8F1005T5E; Package: 0805 (2012 metric); LCSC Part Number: C26108; Value: 10M

## Sheet Bluetooth.SchDoc
size A; Author: Jared Ainsworth; CompanyName: UpRev LLC; Engineer: Jared Ainsworth; Organization: UpRev LLC; Address1: 4807 Commercial Park Dr.; Address2: Austin, TX 78724; Address3: United States; Address4: www.UpRev.com; SheetNumber: 4; SheetTotal: 13
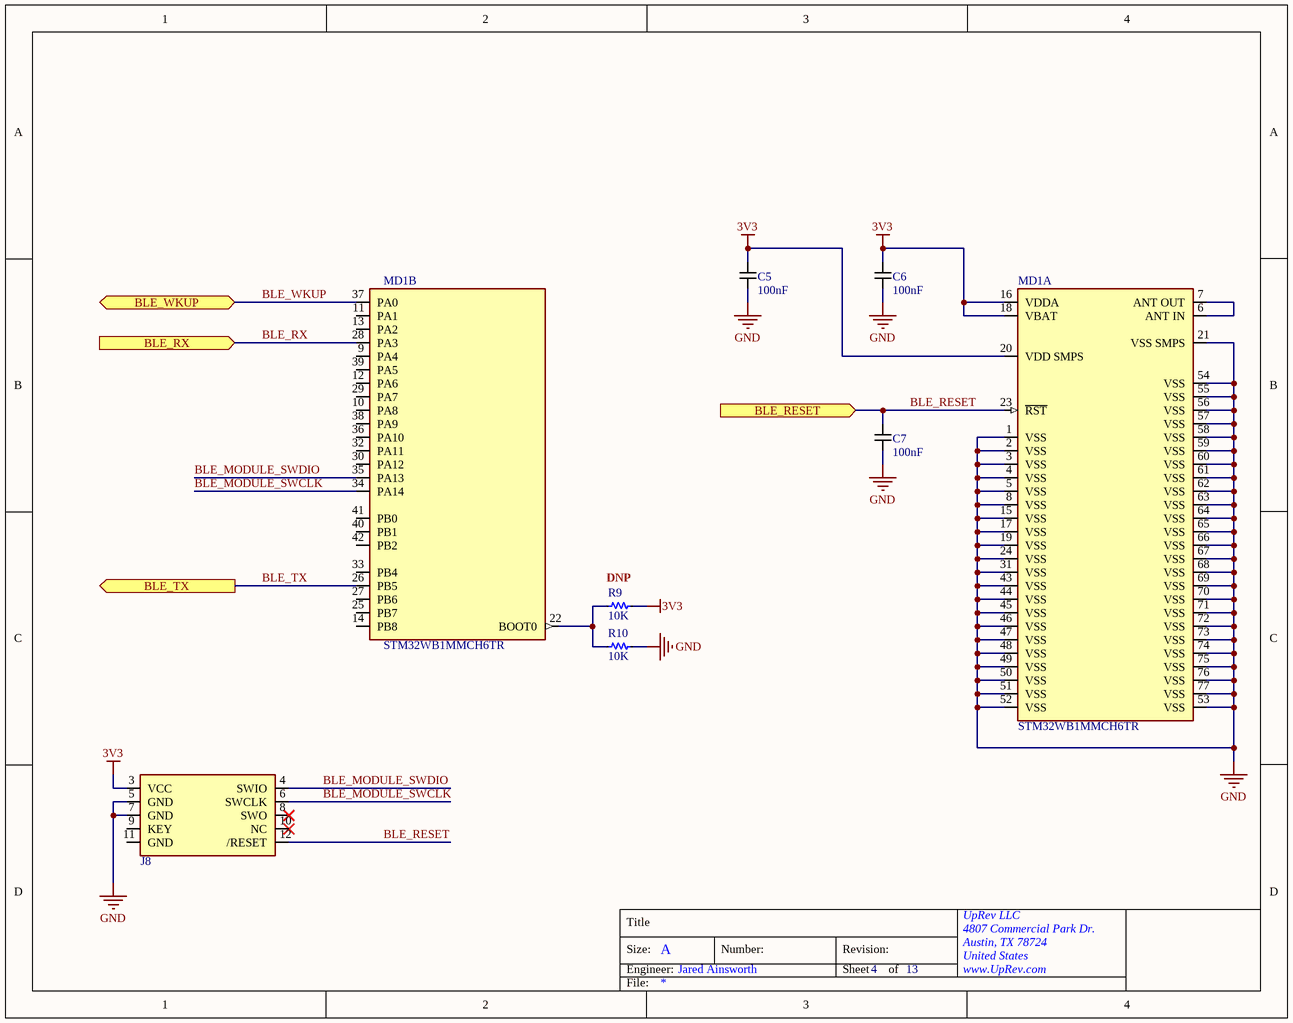
[diagram p8: Bluetooth.SchDoc]

### Parts
C5  100nF  [C0402 (1005)]
C6  100nF  [C0402 (1005)]
C7  100nF  [C0402 (1005)]
J8  JTAG 14 Pos Header 1.27mm Pitch (.5") (ST Micro)  [Connector 14 Pos Samtec SHF-107-01-L-D-SM]  (value not drawn)
MD1  STM32WB1MMCH6TR  [LGA-77]  (parts A,B of 2)
R9  10K  [R0402 (1005)]  (no BOM)
R10  10K  [R0402 (1005)]

### Ports
BLE_RESET (in, see Top_Level[2D], Dev_Board_Connection[3B]), BLE_RX (in, see Top_Level[2D], Dev_Board_Connection[2B]), BLE_TX (out, see Top_Level[2D], Dev_Board_Connection[2B]), BLE_WKUP (bidir, see Top_Level[2D], Dev_Board_Connection[2B])

### Nets
3V3: C5.1 C6.1 J8.3(VCC) MD1.16(VDDA) MD1.18(VBAT) MD1.20(VDD_SMPS) R9.2
GND: C5.2 C6.2 C7.2 J8.5(GND) J8.7(GND) MD1.1(VSS) MD1.2(VSS) MD1.3(VSS) MD1.4(VSS) MD1.5(VSS) MD1.8(VSS) MD1.15(VSS) MD1.17(VSS) MD1.19(VSS) MD1.21(VSS_SMPS) MD1.24(VSS) MD1.31(VSS) MD1.43(VSS) MD1.44(VSS) MD1.45(VSS) MD1.46(VSS) MD1.47(VSS) MD1.48(VSS) MD1.49(VSS) MD1.50(VSS) MD1.51(VSS) MD1.52(VSS) MD1.53(VSS) MD1.54(VSS) MD1.55(VSS) MD1.56(VSS) MD1.57(VSS) MD1.58(VSS) MD1.59(VSS) MD1.60(VSS) MD1.61(VSS) MD1.62(VSS) MD1.63(VSS) MD1.64(VSS) MD1.65(VSS) MD1.66(VSS) MD1.67(VSS) MD1.68(VSS) MD1.69(VSS) MD1.70(VSS) MD1.71(VSS) MD1.72(VSS) MD1.73(VSS) MD1.74(VSS) MD1.75(VSS) MD1.76(VSS) MD1.77(VSS) R10.2
BLE_MODULE_SWCLK: J8.6(SWCLK) MD1.34(PA14)
BLE_MODULE_SWDIO: J8.4(SWIO) MD1.35(PA13)
BLE_RESET: C7.1 J8.12(/RESET) MD1.23(~{RST}) ; port BLE_RESET
BLE_RX: MD1.28(PA3) ; port BLE_RX
BLE_TX: MD1.26(PB5) ; port BLE_TX
BLE_WKUP: MD1.37(PA0) ; port BLE_WKUP
NetMD1_6: MD1.6(ANT_IN) MD1.7(ANT_OUT)
NetMD1_22: MD1.22(BOOT0) R9.1 R10.1

Not connected (* = marked no-connect by the designer): J8 8(SWO)* 9(KEY) 10(NC)* 11(GND); MD1 9(PA4) 10(PA8) 11(PA1) 12(PA6) 13(PA2) 14(PB8) 25(PB7) 27(PB6) 29(PA7) 30(PA12) 32(PA11) 33(PB4) 36(PA10) 38(PA9) 39(PA5) 40(PB1) 41(PB0) 42(PB2)

### Notes on the sheet
- (near R9) DNP
- Title
- Size:
- Engineer:
- A
- Number:
- Revision:
- Sheet
- of
- File:

### Library data of the parts
C5-C7 = 100nF Ceramic, 16V, 0402 (1005): as C4 on sheet USB_Host; Package: 0402 (1005 metric); LCSC Part Number: C1525; Value: 100nF
J8 = JTAG 14 Pos Header 1.27mm Pitch (.5") (ST Micro): JTAG 14 Pos Header, 1.27mm Pitch, (.5"), (ST Micro); Manufacturer: Samtec; Manufacturer Part Number: SHF-107-01-L-D-SM-LC; LCSC Part Number: C17540447; Package: SMD
MD1 = STM32WB1MMCH6TR: Bluetooth Low Energy Module; Manufacturer: STMicroelectronics; LCSC Part Number: C5456183; Package: LGA-77(6.5x10); Manufacturer Part Number: STM32WB1MMCH6TR
R9 R10 = 10K ohm, 0402 (1005): as R3 on sheet Input_Power; Package: 0402 (1005 metric); LCSC Part Number: C881209; Value: 10K

## Sheet OBD_II_Connector.SchDoc
size A; Author: Jared Ainsworth; CompanyName: UpRev LLC; Engineer: Jared Ainsworth; Organization: UpRev LLC; Address1: 4807 Commercial Park Dr.; Address2: Austin, TX 78724; Address3: United States; Address4: www.UpRev.com; SheetNumber: 5; SheetTotal: 13
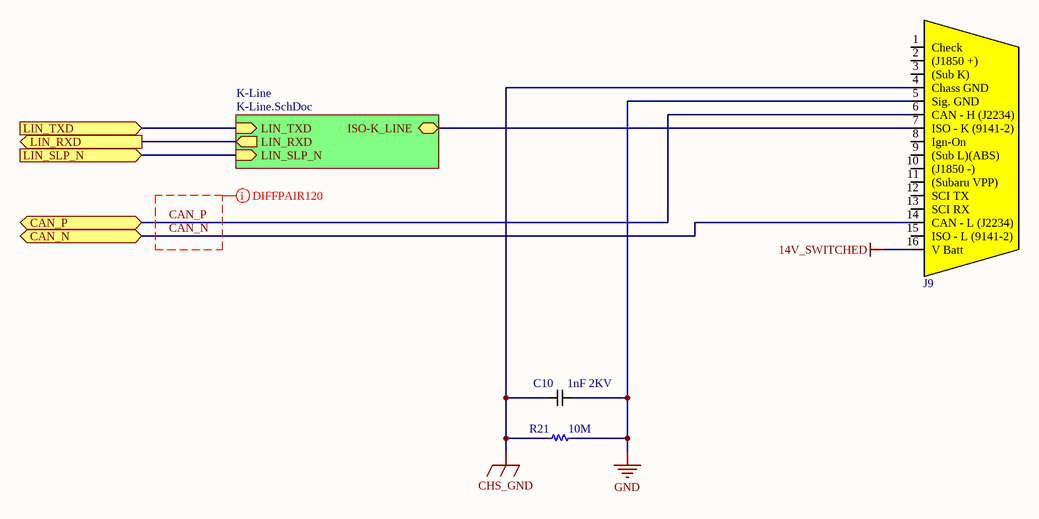
[diagram p9: OBD_II_Connector.SchDoc]

### Parts
C10  1nF 2KV  [C1206 (3216)]
J9  16 Pos J1962F Female OBDII Connector  [Connector 16 Pos J1962F Female OBDII Connector]  (value not drawn)  (no BOM)
R21  10M  [R0805 (2012), TIGHT]

### Sub-sheets
K-Line = K-Line.SchDoc: LIN_TXD (in), LIN_RXD (out), LIN_SLP_N (in), ISO-K_LINE (bidir)

### Ports
CAN_N (bidir, see Top_Level[2C], Dev_Board_Connection[1C]), CAN_P (bidir, see Top_Level[2C], Dev_Board_Connection[1C]), LIN_RXD (out, see Top_Level[2B], Dev_Board_Connection[3B], K-Line[1B]), LIN_SLP_N (in, see Top_Level[2B], Dev_Board_Connection[2B], K-Line[1B]), LIN_TXD (in, see Top_Level[2B], Dev_Board_Connection[2B], K-Line[1C])

### Nets
14V_SWITCHED: J9.16(V_Batt)
CHS_GND: C10.1 J9.4(Chass_GND) R21.1
GND: C10.2 J9.5(Sig._GND) R21.2
CAN_N: J9.14(CAN_-_L_(J2234)) ; port CAN_N
CAN_P: J9.6(CAN_-_H_(J2234)) ; port CAN_P
ISO-K_LINE: J9.7(ISO_-_K_(9141-2)) ; sheet K-Line/ISO-K_LINE
LIN_RXD: port LIN_RXD, sheet K-Line/LIN_RXD
LIN_SLP_N: port LIN_SLP_N, sheet K-Line/LIN_SLP_N
LIN_TXD: port LIN_TXD, sheet K-Line/LIN_TXD

Not connected (* = marked no-connect by the designer): J9 1(Check) 2((J1850_+)) 3((Sub_K)) 8(Ign-On) 9((Sub_L)(ABS)) 10((J1850_-)) 11((Subaru_VPP)) 12(SCI_TX) 13(SCI_RX) 15(ISO_-_L_(9141-2))

### Layout directives
differential pair; differential pair class CANBUS: CAN_N, CAN_P

### Notes on the sheet
- Title
- Size:
- Engineer:
- A
- Number:
- Revision:
- Sheet
- of
- File:

### Library data of the parts
C10 = 1nF Ceramic, 2KV, X7R, 1206 (3216): as C3 on sheet USB_Host; Package: 1206 (3216 metric); Value: 1nF 2KV; LCSC Part Number: C23631
J9 = 16 Pos J1962F Female OBDII Connector: Vendor: Nemalyn Segura <nemalyn@autotestaid.com>
R21 = 10M ohm, 0805 (2012): as R8 on sheet USB_Host; Package: 0805 (2012 metric); LCSC Part Number: C26108; Value: 10M

## Sheet K-Line.SchDoc
size A; Author: Jared Ainsworth; CompanyName: UpRev LLC; Engineer: Jared Ainsworth; Organization: UpRev LLC; Address1: 4807 Commercial Park Dr.; Address2: Austin, TX 78724; Address3: United States; Address4: www.UpRev.com; SheetNumber: 6; SheetTotal: 13
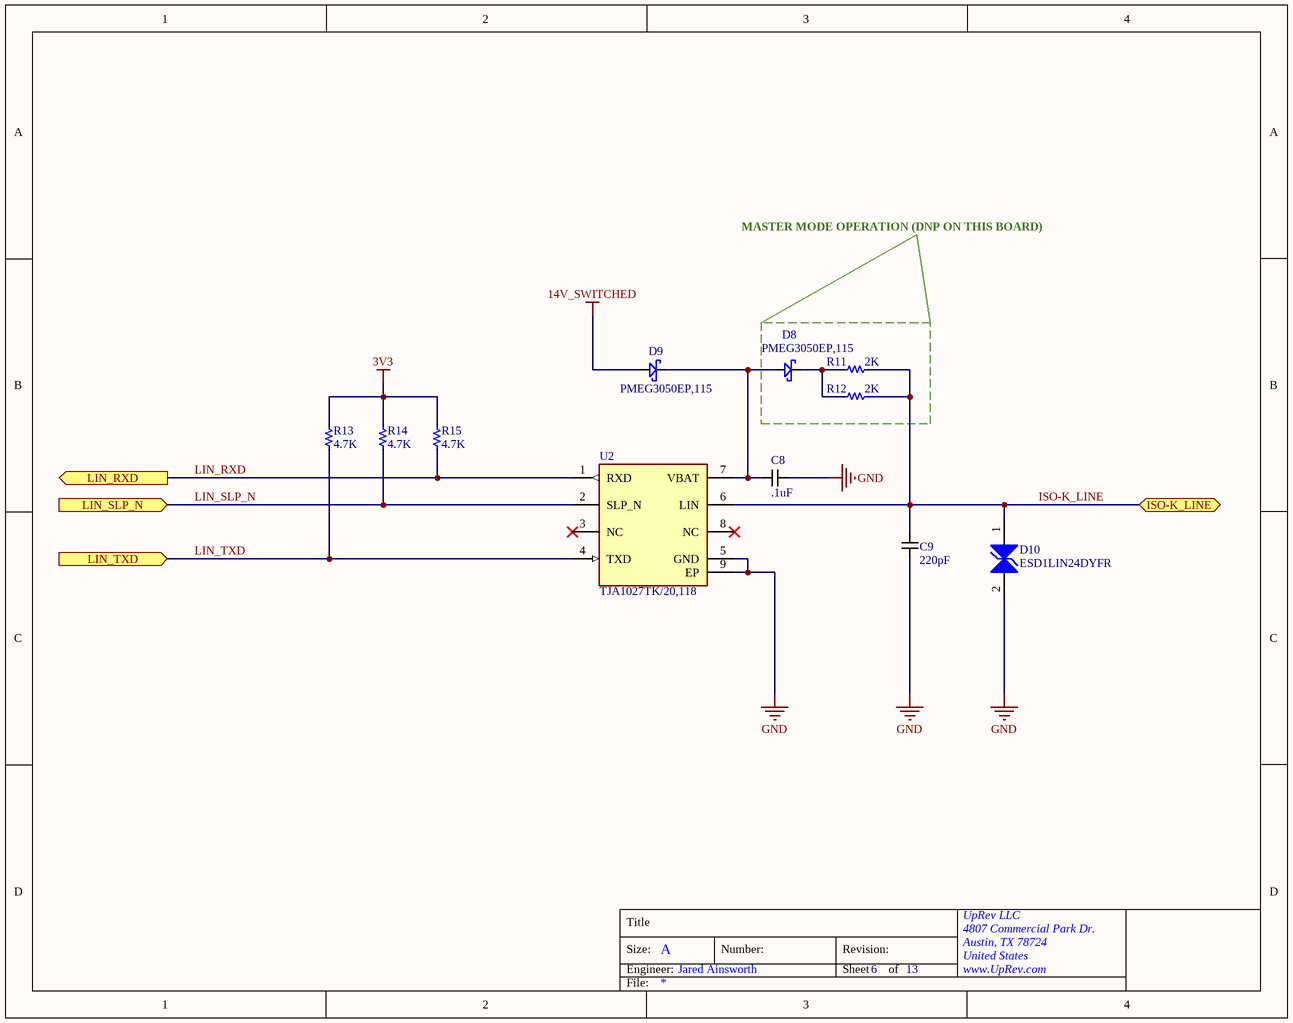
[diagram p10: K-Line.SchDoc]

### Parts
C8  .1uF  [C0603 (1608)]
C9  220pF  [C0603 (1608), TIGHT]
D8  PMEG3050EP,115  [SOD-128]
D9  PMEG3050EP,115  [SOD-128]
D10  3-PF 24-V 30-KV ESD PROTECTION D  [SOD-323_IPC_C]  (value not drawn)
R11  2K  [R0603 (1608)]
R12  2K  [R0603 (1608)]
R13  4.7K  [R0402 (1005)]
R14  4.7K  [R0402 (1005)]
R15  4.7K  [R0402 (1005)]
U2  IC TRANSCEIVER 1/1 8HVSON  [HVSON-8]  (value not drawn)

### Ports
ISO-K_LINE (bidir, see OBD_II_Connector[2B]), LIN_RXD (out, see OBD_II_Connector[2B], Dev_Board_Connection[3B], OBD_II_Connector[1B]), LIN_SLP_N (in, see OBD_II_Connector[2B], Dev_Board_Connection[2B], OBD_II_Connector[1B]), LIN_TXD (in, see OBD_II_Connector[2B], Dev_Board_Connection[2B], OBD_II_Connector[1B])

### Nets
3V3: R13.2 R14.2 R15.2
14V_SWITCHED: D9.2(Anode)
GND: C8.2 C9.2 D10.2(GND) U2.5(GND) U2.9(EP)
ISO-K_LINE: C9.1 D10.1(IO) R11.2 R12.2 U2.6(LIN) ; port ISO-K_LINE
LIN_RXD: R15.1 U2.1(RXD) ; port LIN_RXD
LIN_SLP_N: R14.1 U2.2(SLP_N) ; port LIN_SLP_N
LIN_TXD: R13.1 U2.4(TXD) ; port LIN_TXD
NetC8_1: C8.1 D8.2(Anode) D9.1(Cathode) U2.7(VBAT)
NetD8_1: D8.1(Cathode) R11.1 R12.1

Not connected (* = marked no-connect by the designer): U2 3(NC)* 8(NC)*

### Notes on the sheet
- MASTER MODE OPERATION (DNP ON THIS BOARD)
- Title
- Size:
- Engineer:
- A
- Number:
- Revision:
- Sheet
- of
- File:

### Library data of the parts
C8 = 100nF Ceramic, 25V, 0603 (1608): as C1 on sheet Input_Power; Package: 0603 (1608 metric); LCSC Part Number: C1590; Value: .1uF
C9 = 220pF Ceramic, 100V, 0603 (1608): 220pF Ceramic, 100V, ±10%, X7R, 0603 (1608); Manufacturer Part Number: CL10B221KC85PNC; Manufacturer: Samsung Electro-Mechanics; Package: 0603 (1608 metric); Value: 220pF; LCSC Part Number: C16194548
D8 D9 = PMEG3050EP,115: as D1 on sheet Input_Power; Package: SOD-128; LCSC Part Number: C50603; Manufacturer Part Number: PMEG3050EP,115
D10 = ESD1LIN24DYFR: 42V Clamp 4.3A (8/20µs) Ipp Tvs Diode Surface Mount SOD-323; Manufacturer: Texas Instruments; LCSC Part Number: C20345389; Package: SOD-323; Manufacturer Part Number: ESD1LIN24DYFR
R11 R12 = 2K ohm, 0603 (1608): 2K ohm, ±1%, 0603 (1608); Manufacturer: UNI-ROYAL(Uniroyal Elec); Manufacturer Part Number: 0603WAF2001T5E; Package: 0603 (1608 metric); LCSC Part Number: C22975; Value: 2K
R13-R15 = 4.7K ohm, 0402 (1005): 4.7K ohm, Resistor, ±1%, 0402 (1005); Manufacturer: UNI-ROYAL(Uniroyal Elec); Manufacturer Part Number: 0402WGF4701TCE; Package: 0402 (1005 metric); LCSC Part Number: C25900; Value: 4.7K
U2 = TJA1027TK/20,118: 1/1 Transceiver LINbus 8-HVSON (3x3); Manufacturer: NXP Semicon; LCSC Part Number: C194379; Package: HVSON-8-EP(3x3); Manufacturer Part Number: TJA1027TK/20,118

## Sheet JTAG_Product_Programmer_Interface.SchDoc
size A; Author: Jared Ainsworth; CompanyName: UpRev LLC; Engineer: Jared Ainsworth; Organization: UpRev LLC; Address1: 4807 Commercial Park Dr.; Address2: Austin, TX 78724; Address3: United States; Address4: www.UpRev.com; SheetNumber: 8; SheetTotal: 13
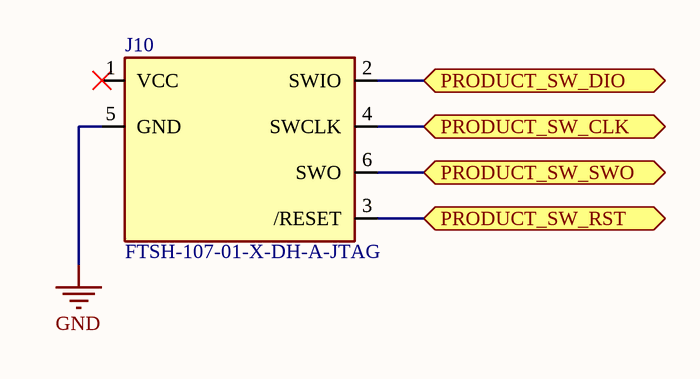
[diagram p11: JTAG_Product_Programmer_Interface.SchDoc]

### Parts
J10  FTSH-107-01-X-DH-A-JTAG  [Connector 14 pos SAMTEC_FTSH-107-01-X-DH-A]

### Ports
PRODUCT_SW_CLK (bidir, see Top_Level[2B], Dev_Board_Connection[3B]), PRODUCT_SW_DIO (bidir, see Top_Level[2B], Dev_Board_Connection[2B]), PRODUCT_SW_RST (bidir, see Top_Level[2B], Dev_Board_Connection[2B]), PRODUCT_SW_SWO (bidir, see Top_Level[2B], Dev_Board_Connection[3B])

### Nets
GND: J10.5(GND)
NetJ1_10: J10.4(SWCLK) ; port PRODUCT_SW_CLK
NetJ1_13: J10.2(SWIO) ; port PRODUCT_SW_DIO
NetJ1_15: J10.3(/RESET) ; port PRODUCT_SW_RST
NetJ1_16: J10.6(SWO) ; port PRODUCT_SW_SWO

Not connected (* = marked no-connect by the designer): J10 1(VCC)*

### Notes on the sheet
- Title
- Size:
- Engineer:
- A
- Number:
- Revision:
- Sheet
- of
- File:

### Library data of the parts
J10 = FTSH-107-01-X-DH-A-JTAG: 14 pos High Reliability Header Strips, 0.050in pitch, Right Angle, Alignment Pins; Manufacturer: Samtec; Package: SMD,P=1.27mm,Surface Mount，Right Angle; Manufacturer Part Number: FTSH-107-01-X-DH-A; LCSC Part Number: C21934755

## Sheet JTAG_Rig_Programmer_Interface.SchDoc
size A; Author: Jared Ainsworth; CompanyName: UpRev LLC; Engineer: Jared Ainsworth; Organization: UpRev LLC; Address1: 4807 Commercial Park Dr.; Address2: Austin, TX 78724; Address3: United States; Address4: www.UpRev.com; SheetNumber: 7; SheetTotal: 13
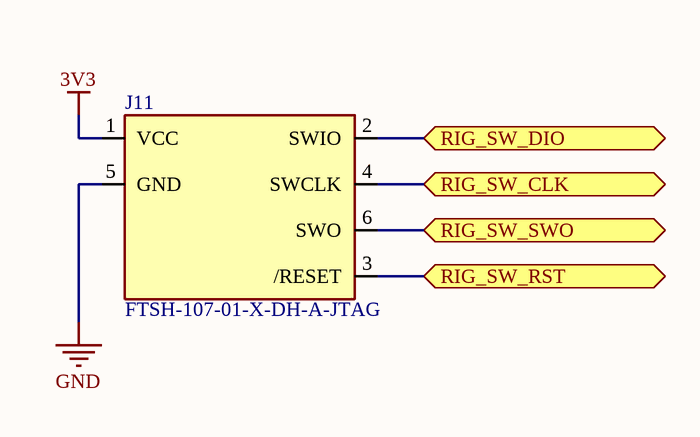
[diagram p12: JTAG_Rig_Programmer_Interface.SchDoc]

### Parts
J11  FTSH-107-01-X-DH-A-JTAG  [Connector 14 pos SAMTEC_FTSH-107-01-X-DH-A]

### Ports
RIG_SW_CLK (bidir, see Top_Level[2A], Dev_Board_Connection[1D]), RIG_SW_DIO (bidir, see Top_Level[2B], Dev_Board_Connection[1D]), RIG_SW_RST (bidir, see Top_Level[2B], Dev_Board_Connection[1D]), RIG_SW_SWO (bidir, see Top_Level[2B], Dev_Board_Connection[1D])

### Nets
3V3: J11.1(VCC)
GND: J11.5(GND)
NetJ5_2: J11.4(SWCLK) ; port RIG_SW_CLK
NetJ5_4: J11.2(SWIO) ; port RIG_SW_DIO
NetJ5_5: J11.3(/RESET) ; port RIG_SW_RST
NetJ5_6: J11.6(SWO) ; port RIG_SW_SWO

### Notes on the sheet
- Title
- Size:
- Engineer:
- A
- Number:
- Revision:
- Sheet
- of
- File:

### Library data of the parts
J11 = FTSH-107-01-X-DH-A-JTAG: as J10 on sheet JTAG_Product_Programmer_Interface; Package: SMD,P=1.27mm,Surface Mount，Right Angle; Manufacturer Part Number: FTSH-107-01-X-DH-A; LCSC Part Number: C21934755

## Nets that join several sheets
3V3: 3V3_Buck (7 pins), Bluetooth (7 pins), K-Line (R13.2 R14.2 R15.2), JTAG_Rig_Programmer_Interface (J11.1)
14V: 14V_Buck (C17.1 L2.2 R22.2 R23.2), Vehicle_Power (Q3.2 R16.2)
14V_SWITCHED: Vehicle_Power (Q3.3 R17.2), OBD_II_Connector (J9.16), K-Line (D9.2)
24V_SW: Dev_Board_Connection (J4.1 J4.2 J4.3), Input_Power (D1.1), 14V_Buck (6 pins), 3V3_Buck (6 pins)
CHS_GND: USB_Host (6 pins), OBD_II_Connector (C10.1 J9.4 R21.1)
GND: Dev_Board_Connection (14 pins), Input_Power (10 pins), 14V_Buck (11 pins), Vehicle_Power (Q4.2 R17.1 R20.1), 3V3_Buck (12 pins), USB_Host (8 pins), Bluetooth (53 pins), OBD_II_Connector (C10.2 J9.5 R21.2), K-Line (5 pins), JTAG_Product_Programmer_Interface (J10.5), JTAG_Rig_Programmer_Interface (J11.5)
VBUS: Dev_Board_Connection (J3.1), USB_Host (6 pins)
BLE_RESET: Dev_Board_Connection (J1.36), Bluetooth (C7.1 J8.12 MD1.23)
BLE_RX: Dev_Board_Connection (J1.27), Bluetooth (MD1.28)
BLE_TX: Dev_Board_Connection (J1.25), Bluetooth (MD1.26)
BLE_WKUP: Dev_Board_Connection (J1.33), Bluetooth (MD1.37)
CAN_N: Dev_Board_Connection (J2.2 R1.2), OBD_II_Connector (J9.14)
CAN_P: Dev_Board_Connection (J2.3 R1.1), OBD_II_Connector (J9.6)
ISO-K_LINE: OBD_II_Connector (J9.7), K-Line (5 pins)
LIN_RXD: Dev_Board_Connection (J1.14), K-Line (R15.1 U2.1)
LIN_SLP_N: Dev_Board_Connection (J1.9), K-Line (R14.1 U2.2)
LIN_TXD: Dev_Board_Connection (J1.37), K-Line (R13.1 U2.4)
NetJ1_10: Dev_Board_Connection (J1.10), JTAG_Product_Programmer_Interface (J10.4)
NetJ1_11: Dev_Board_Connection (J1.11), Vehicle_Power (R19.2)
NetJ1_13: Dev_Board_Connection (J1.13), JTAG_Product_Programmer_Interface (J10.2)
NetJ1_15: Dev_Board_Connection (J1.15), JTAG_Product_Programmer_Interface (J10.3)
NetJ1_16: Dev_Board_Connection (J1.16), JTAG_Product_Programmer_Interface (J10.6)
NetJ5_2: Dev_Board_Connection (J5.2), JTAG_Rig_Programmer_Interface (J11.4)
NetJ5_4: Dev_Board_Connection (J5.4), JTAG_Rig_Programmer_Interface (J11.2)
NetJ5_5: Dev_Board_Connection (J5.5), JTAG_Rig_Programmer_Interface (J11.3)
NetJ5_6: Dev_Board_Connection (J5.6), JTAG_Rig_Programmer_Interface (J11.6)
USB_D_N: Dev_Board_Connection (J3.2), USB_Host (L1.3)
USB_D_P: Dev_Board_Connection (J3.3), USB_Host (L1.4)